# Altium schematic sheet 940nm-LED-Sheet.SchDoc
size 420 x 297 mm; SheetNumber: 6; SheetTotal: 6
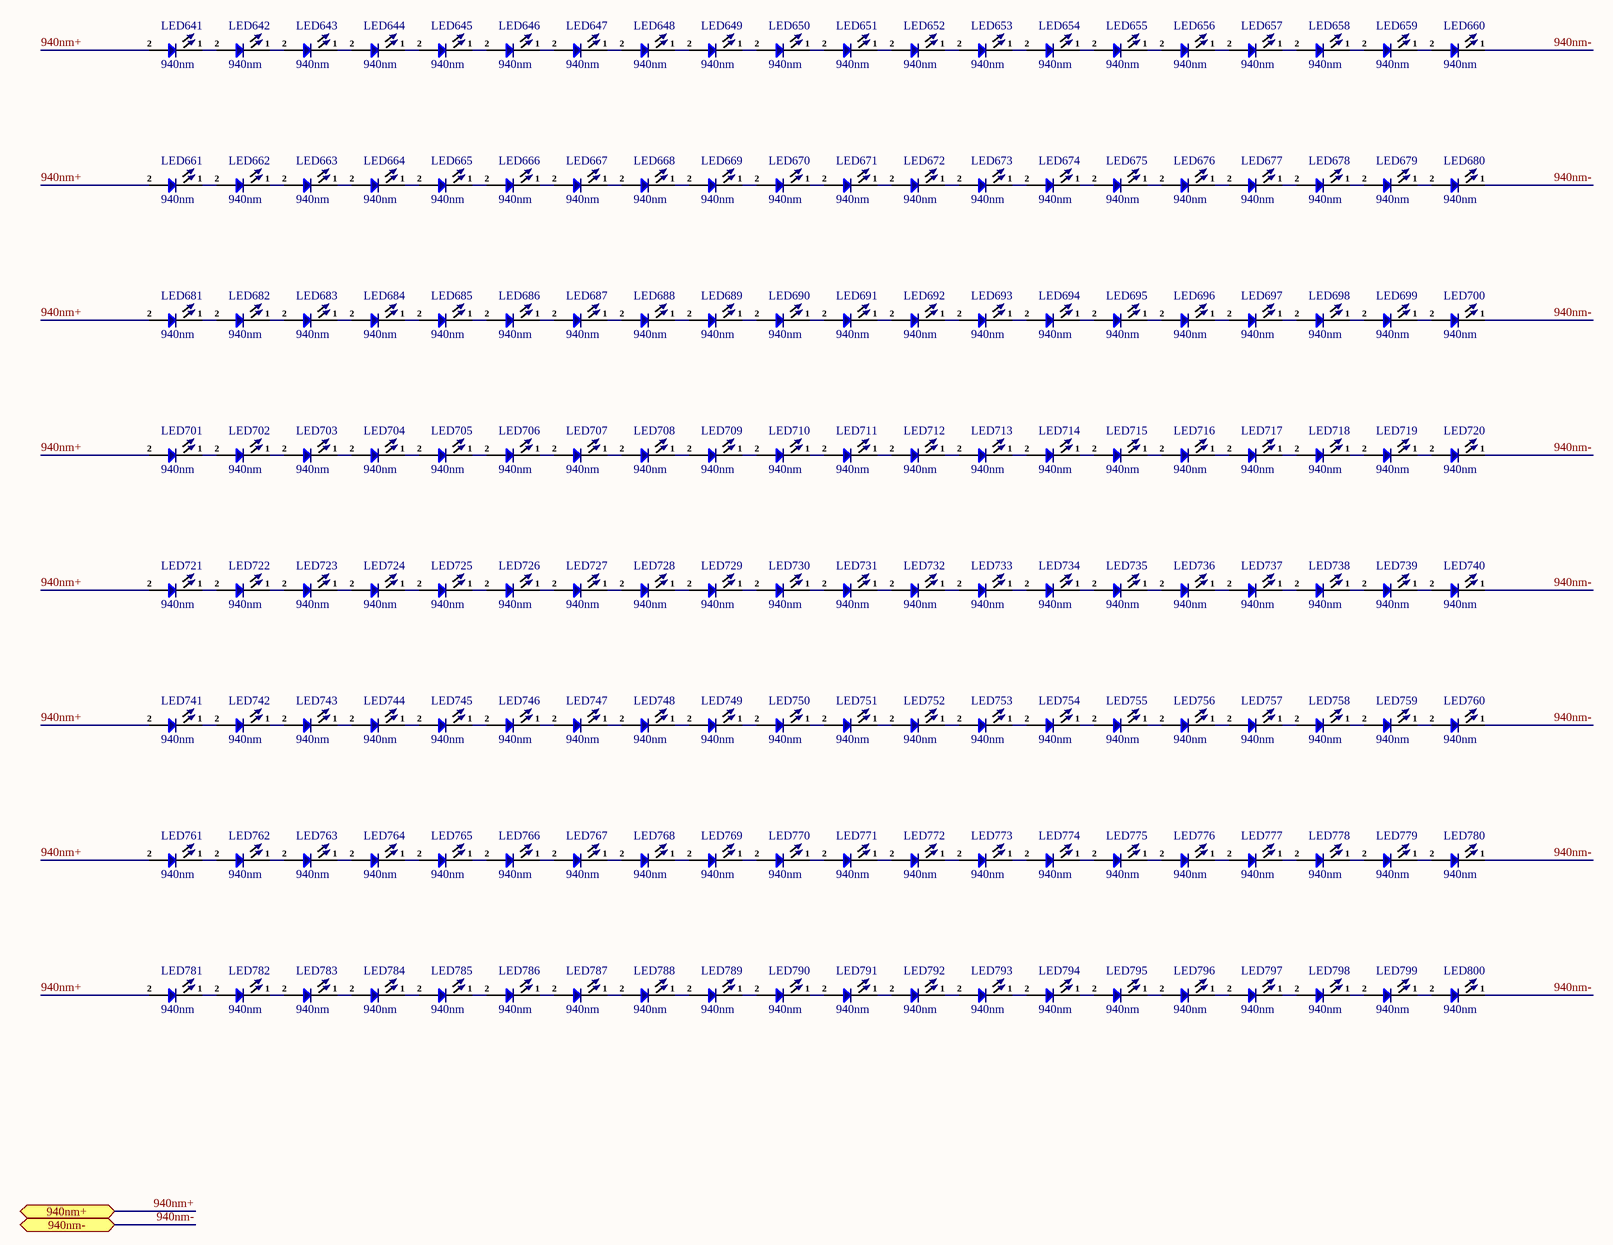
[diagram p0: 940nm-LED-Sheet.SchDoc]

## Parts
LED641  940nm  [TH LED 3mm_]
LED642  940nm  [TH LED 3mm_]
LED643  940nm  [TH LED 3mm_]
LED644  940nm  [TH LED 3mm_]
LED645  940nm  [TH LED 3mm_]
LED646  940nm  [TH LED 3mm_]
LED647  940nm  [TH LED 3mm_]
LED648  940nm  [TH LED 3mm_]
LED649  940nm  [TH LED 3mm_]
LED650  940nm  [TH LED 3mm_]
LED651  940nm  [TH LED 3mm_]
LED652  940nm  [TH LED 3mm_]
LED653  940nm  [TH LED 3mm_]
LED654  940nm  [TH LED 3mm_]
LED655  940nm  [TH LED 3mm_]
LED656  940nm  [TH LED 3mm_]
LED657  940nm  [TH LED 3mm_]
LED658  940nm  [TH LED 3mm_]
LED659  940nm  [TH LED 3mm_]
LED660  940nm  [TH LED 3mm_]
LED661  940nm  [TH LED 3mm_]
LED662  940nm  [TH LED 3mm_]
LED663  940nm  [TH LED 3mm_]
LED664  940nm  [TH LED 3mm_]
LED665  940nm  [TH LED 3mm_]
LED666  940nm  [TH LED 3mm_]
LED667  940nm  [TH LED 3mm_]
LED668  940nm  [TH LED 3mm_]
LED669  940nm  [TH LED 3mm_]
LED670  940nm  [TH LED 3mm_]
LED671  940nm  [TH LED 3mm_]
LED672  940nm  [TH LED 3mm_]
LED673  940nm  [TH LED 3mm_]
LED674  940nm  [TH LED 3mm_]
LED675  940nm  [TH LED 3mm_]
LED676  940nm  [TH LED 3mm_]
LED677  940nm  [TH LED 3mm_]
LED678  940nm  [TH LED 3mm_]
LED679  940nm  [TH LED 3mm_]
LED680  940nm  [TH LED 3mm_]
LED681  940nm  [TH LED 3mm_]
LED682  940nm  [TH LED 3mm_]
LED683  940nm  [TH LED 3mm_]
LED684  940nm  [TH LED 3mm_]
LED685  940nm  [TH LED 3mm_]
LED686  940nm  [TH LED 3mm_]
LED687  940nm  [TH LED 3mm_]
LED688  940nm  [TH LED 3mm_]
LED689  940nm  [TH LED 3mm_]
LED690  940nm  [TH LED 3mm_]
LED691  940nm  [TH LED 3mm_]
LED692  940nm  [TH LED 3mm_]
LED693  940nm  [TH LED 3mm_]
LED694  940nm  [TH LED 3mm_]
LED695  940nm  [TH LED 3mm_]
LED696  940nm  [TH LED 3mm_]
LED697  940nm  [TH LED 3mm_]
LED698  940nm  [TH LED 3mm_]
LED699  940nm  [TH LED 3mm_]
LED700  940nm  [TH LED 3mm_]
LED701  940nm  [TH LED 3mm_]
LED702  940nm  [TH LED 3mm_]
LED703  940nm  [TH LED 3mm_]
LED704  940nm  [TH LED 3mm_]
LED705  940nm  [TH LED 3mm_]
LED706  940nm  [TH LED 3mm_]
LED707  940nm  [TH LED 3mm_]
LED708  940nm  [TH LED 3mm_]
LED709  940nm  [TH LED 3mm_]
LED710  940nm  [TH LED 3mm_]
LED711  940nm  [TH LED 3mm_]
LED712  940nm  [TH LED 3mm_]
LED713  940nm  [TH LED 3mm_]
LED714  940nm  [TH LED 3mm_]
LED715  940nm  [TH LED 3mm_]
LED716  940nm  [TH LED 3mm_]
LED717  940nm  [TH LED 3mm_]
LED718  940nm  [TH LED 3mm_]
LED719  940nm  [TH LED 3mm_]
LED720  940nm  [TH LED 3mm_]
LED721  940nm  [TH LED 3mm_]
LED722  940nm  [TH LED 3mm_]
LED723  940nm  [TH LED 3mm_]
LED724  940nm  [TH LED 3mm_]
LED725  940nm  [TH LED 3mm_]
LED726  940nm  [TH LED 3mm_]
LED727  940nm  [TH LED 3mm_]
LED728  940nm  [TH LED 3mm_]
LED729  940nm  [TH LED 3mm_]
LED730  940nm  [TH LED 3mm_]
LED731  940nm  [TH LED 3mm_]
LED732  940nm  [TH LED 3mm_]
LED733  940nm  [TH LED 3mm_]
LED734  940nm  [TH LED 3mm_]
LED735  940nm  [TH LED 3mm_]
LED736  940nm  [TH LED 3mm_]
LED737  940nm  [TH LED 3mm_]
LED738  940nm  [TH LED 3mm_]
LED739  940nm  [TH LED 3mm_]
LED740  940nm  [TH LED 3mm_]
LED741  940nm  [TH LED 3mm_]
LED742  940nm  [TH LED 3mm_]
LED743  940nm  [TH LED 3mm_]
LED744  940nm  [TH LED 3mm_]
LED745  940nm  [TH LED 3mm_]
LED746  940nm  [TH LED 3mm_]
LED747  940nm  [TH LED 3mm_]
LED748  940nm  [TH LED 3mm_]
LED749  940nm  [TH LED 3mm_]
LED750  940nm  [TH LED 3mm_]
LED751  940nm  [TH LED 3mm_]
LED752  940nm  [TH LED 3mm_]
LED753  940nm  [TH LED 3mm_]
LED754  940nm  [TH LED 3mm_]
LED755  940nm  [TH LED 3mm_]
LED756  940nm  [TH LED 3mm_]
LED757  940nm  [TH LED 3mm_]
LED758  940nm  [TH LED 3mm_]
LED759  940nm  [TH LED 3mm_]
LED760  940nm  [TH LED 3mm_]
LED761  940nm  [TH LED 3mm_]
LED762  940nm  [TH LED 3mm_]
LED763  940nm  [TH LED 3mm_]
LED764  940nm  [TH LED 3mm_]
LED765  940nm  [TH LED 3mm_]
LED766  940nm  [TH LED 3mm_]
LED767  940nm  [TH LED 3mm_]
LED768  940nm  [TH LED 3mm_]
LED769  940nm  [TH LED 3mm_]
LED770  940nm  [TH LED 3mm_]
LED771  940nm  [TH LED 3mm_]
LED772  940nm  [TH LED 3mm_]
LED773  940nm  [TH LED 3mm_]
LED774  940nm  [TH LED 3mm_]
LED775  940nm  [TH LED 3mm_]
LED776  940nm  [TH LED 3mm_]
LED777  940nm  [TH LED 3mm_]
LED778  940nm  [TH LED 3mm_]
LED779  940nm  [TH LED 3mm_]
LED780  940nm  [TH LED 3mm_]
LED781  940nm  [TH LED 3mm_]
LED782  940nm  [TH LED 3mm_]
LED783  940nm  [TH LED 3mm_]
LED784  940nm  [TH LED 3mm_]
LED785  940nm  [TH LED 3mm_]
LED786  940nm  [TH LED 3mm_]
LED787  940nm  [TH LED 3mm_]
LED788  940nm  [TH LED 3mm_]
LED789  940nm  [TH LED 3mm_]
LED790  940nm  [TH LED 3mm_]
LED791  940nm  [TH LED 3mm_]
LED792  940nm  [TH LED 3mm_]
LED793  940nm  [TH LED 3mm_]
LED794  940nm  [TH LED 3mm_]
LED795  940nm  [TH LED 3mm_]
LED796  940nm  [TH LED 3mm_]
LED797  940nm  [TH LED 3mm_]
LED798  940nm  [TH LED 3mm_]
LED799  940nm  [TH LED 3mm_]
LED800  940nm  [TH LED 3mm_]

## Ports
940nm+ (bidir, see Main-Sheet[4A]), 940nm- (bidir, see Main-Sheet[4A])

## Nets
940nm+: LED641.2 LED661.2 LED681.2 LED701.2 LED721.2 LED741.2 LED761.2 LED781.2 ; port 940nm+
940nm-: LED660.1 LED680.1 LED700.1 LED720.1 LED740.1 LED760.1 LED780.1 LED800.1 ; port 940nm-
NetLED641_1: LED641.1 LED642.2
NetLED642_1: LED642.1 LED643.2
NetLED643_1: LED643.1 LED644.2
NetLED644_1: LED644.1 LED645.2
NetLED645_1: LED645.1 LED646.2
NetLED646_1: LED646.1 LED647.2
NetLED647_1: LED647.1 LED648.2
NetLED648_1: LED648.1 LED649.2
NetLED649_1: LED649.1 LED650.2
NetLED650_1: LED650.1 LED651.2
NetLED651_1: LED651.1 LED652.2
NetLED652_1: LED652.1 LED653.2
NetLED653_1: LED653.1 LED654.2
NetLED654_1: LED654.1 LED655.2
NetLED655_1: LED655.1 LED656.2
NetLED656_1: LED656.1 LED657.2
NetLED657_1: LED657.1 LED658.2
NetLED658_1: LED658.1 LED659.2
NetLED659_1: LED659.1 LED660.2
NetLED661_1: LED661.1 LED662.2
NetLED662_1: LED662.1 LED663.2
NetLED663_1: LED663.1 LED664.2
NetLED664_1: LED664.1 LED665.2
NetLED665_1: LED665.1 LED666.2
NetLED666_1: LED666.1 LED667.2
NetLED667_1: LED667.1 LED668.2
NetLED668_1: LED668.1 LED669.2
NetLED669_1: LED669.1 LED670.2
NetLED670_1: LED670.1 LED671.2
NetLED671_1: LED671.1 LED672.2
NetLED672_1: LED672.1 LED673.2
NetLED673_1: LED673.1 LED674.2
NetLED674_1: LED674.1 LED675.2
NetLED675_1: LED675.1 LED676.2
NetLED676_1: LED676.1 LED677.2
NetLED677_1: LED677.1 LED678.2
NetLED678_1: LED678.1 LED679.2
NetLED679_1: LED679.1 LED680.2
NetLED681_1: LED681.1 LED682.2
NetLED682_1: LED682.1 LED683.2
NetLED683_1: LED683.1 LED684.2
NetLED684_1: LED684.1 LED685.2
NetLED685_1: LED685.1 LED686.2
NetLED686_1: LED686.1 LED687.2
NetLED687_1: LED687.1 LED688.2
NetLED688_1: LED688.1 LED689.2
NetLED689_1: LED689.1 LED690.2
NetLED690_1: LED690.1 LED691.2
NetLED691_1: LED691.1 LED692.2
NetLED692_1: LED692.1 LED693.2
NetLED693_1: LED693.1 LED694.2
NetLED694_1: LED694.1 LED695.2
NetLED695_1: LED695.1 LED696.2
NetLED696_1: LED696.1 LED697.2
NetLED697_1: LED697.1 LED698.2
NetLED698_1: LED698.1 LED699.2
NetLED699_1: LED699.1 LED700.2
NetLED701_1: LED701.1 LED702.2
NetLED702_1: LED702.1 LED703.2
NetLED703_1: LED703.1 LED704.2
NetLED704_1: LED704.1 LED705.2
NetLED705_1: LED705.1 LED706.2
NetLED706_1: LED706.1 LED707.2
NetLED707_1: LED707.1 LED708.2
NetLED708_1: LED708.1 LED709.2
NetLED709_1: LED709.1 LED710.2
NetLED710_1: LED710.1 LED711.2
NetLED711_1: LED711.1 LED712.2
NetLED712_1: LED712.1 LED713.2
NetLED713_1: LED713.1 LED714.2
NetLED714_1: LED714.1 LED715.2
NetLED715_1: LED715.1 LED716.2
NetLED716_1: LED716.1 LED717.2
NetLED717_1: LED717.1 LED718.2
NetLED718_1: LED718.1 LED719.2
NetLED719_1: LED719.1 LED720.2
NetLED721_1: LED721.1 LED722.2
NetLED722_1: LED722.1 LED723.2
NetLED723_1: LED723.1 LED724.2
NetLED724_1: LED724.1 LED725.2
NetLED725_1: LED725.1 LED726.2
NetLED726_1: LED726.1 LED727.2
NetLED727_1: LED727.1 LED728.2
NetLED728_1: LED728.1 LED729.2
NetLED729_1: LED729.1 LED730.2
NetLED730_1: LED730.1 LED731.2
NetLED731_1: LED731.1 LED732.2
NetLED732_1: LED732.1 LED733.2
NetLED733_1: LED733.1 LED734.2
NetLED734_1: LED734.1 LED735.2
NetLED735_1: LED735.1 LED736.2
NetLED736_1: LED736.1 LED737.2
NetLED737_1: LED737.1 LED738.2
NetLED738_1: LED738.1 LED739.2
NetLED739_1: LED739.1 LED740.2
NetLED741_1: LED741.1 LED742.2
NetLED742_1: LED742.1 LED743.2
NetLED743_1: LED743.1 LED744.2
NetLED744_1: LED744.1 LED745.2
NetLED745_1: LED745.1 LED746.2
NetLED746_1: LED746.1 LED747.2
NetLED747_1: LED747.1 LED748.2
NetLED748_1: LED748.1 LED749.2
NetLED749_1: LED749.1 LED750.2
NetLED750_1: LED750.1 LED751.2
NetLED751_1: LED751.1 LED752.2
NetLED752_1: LED752.1 LED753.2
NetLED753_1: LED753.1 LED754.2
NetLED754_1: LED754.1 LED755.2
NetLED755_1: LED755.1 LED756.2
NetLED756_1: LED756.1 LED757.2
NetLED757_1: LED757.1 LED758.2
NetLED758_1: LED758.1 LED759.2
NetLED759_1: LED759.1 LED760.2
NetLED761_1: LED761.1 LED762.2
NetLED762_1: LED762.1 LED763.2
NetLED763_1: LED763.1 LED764.2
NetLED764_1: LED764.1 LED765.2
NetLED765_1: LED765.1 LED766.2
NetLED766_1: LED766.1 LED767.2
NetLED767_1: LED767.1 LED768.2
NetLED768_1: LED768.1 LED769.2
NetLED769_1: LED769.1 LED770.2
NetLED770_1: LED770.1 LED771.2
NetLED771_1: LED771.1 LED772.2
NetLED772_1: LED772.1 LED773.2
NetLED773_1: LED773.1 LED774.2
NetLED774_1: LED774.1 LED775.2
NetLED775_1: LED775.1 LED776.2
NetLED776_1: LED776.1 LED777.2
NetLED777_1: LED777.1 LED778.2
NetLED778_1: LED778.1 LED779.2
NetLED779_1: LED779.1 LED780.2
NetLED781_1: LED781.1 LED782.2
NetLED782_1: LED782.1 LED783.2
NetLED783_1: LED783.1 LED784.2
NetLED784_1: LED784.1 LED785.2
NetLED785_1: LED785.1 LED786.2
NetLED786_1: LED786.1 LED787.2
NetLED787_1: LED787.1 LED788.2
NetLED788_1: LED788.1 LED789.2
NetLED789_1: LED789.1 LED790.2
NetLED790_1: LED790.1 LED791.2
NetLED791_1: LED791.1 LED792.2
NetLED792_1: LED792.1 LED793.2
NetLED793_1: LED793.1 LED794.2
NetLED794_1: LED794.1 LED795.2
NetLED795_1: LED795.1 LED796.2
NetLED796_1: LED796.1 LED797.2
NetLED797_1: LED797.1 LED798.2
NetLED798_1: LED798.1 LED799.2
NetLED799_1: LED799.1 LED800.2

## Notes on the sheet
- File:
- Title:
- Date:
- Page
- Num:
- Total:
- Drawn By: Huzaifa Ali

## Library data of the parts
LED641-LED800 = IR LED 3mm: IR Led 3mm Through; ComponentLink1Description: Aliexpress; ComponentLink1URL: https://nl.aliexpress.com/item/32950109432.html?spm=a2g0o.productlist.0.0.2d9749ecxdTGvK&algo_pvid=f3c88197-d0dd-4360-badc-ef5a9d1d435b&algo_exp_id=f3c88197-d0dd-4360-badc-ef5a9d1d435b-1&pdp_ext_f=%7B%22sku_id%22%3A%2266309321327%22%7D